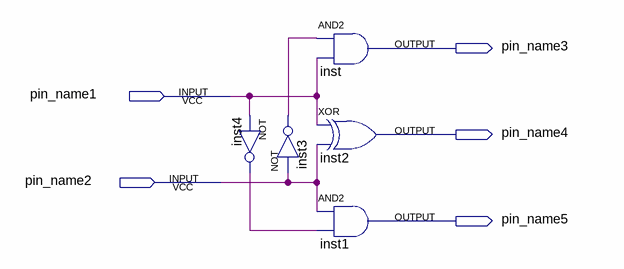
[diagram p0: schematic sheet]
// Quartus schematic ex6.bdf as structural Verilog: 5 symbols, 5 pins
module ex6 (
  input  pin_name1,
  input  pin_name2,
  output pin_name3,
  output pin_name4,
  output pin_name5
);

  wire inst3_out, inst4_out;

  not inst4 (inst4_out, pin_name1);
  and inst (pin_name3, inst3_out, pin_name1);
  xor inst2 (pin_name4, pin_name1, pin_name2);
  not inst3 (inst3_out, pin_name2);
  and inst1 (pin_name5, pin_name2, inst4_out);
endmodule
